# Altium schematic sheet [0] LattePanda_Mu.SchDoc
size B; Organization: Altium Limited; Address1: L3, 12a Rodborough Rd; Address2: Frenchs Forest; Address3: NSW; Address4: Australia 2086
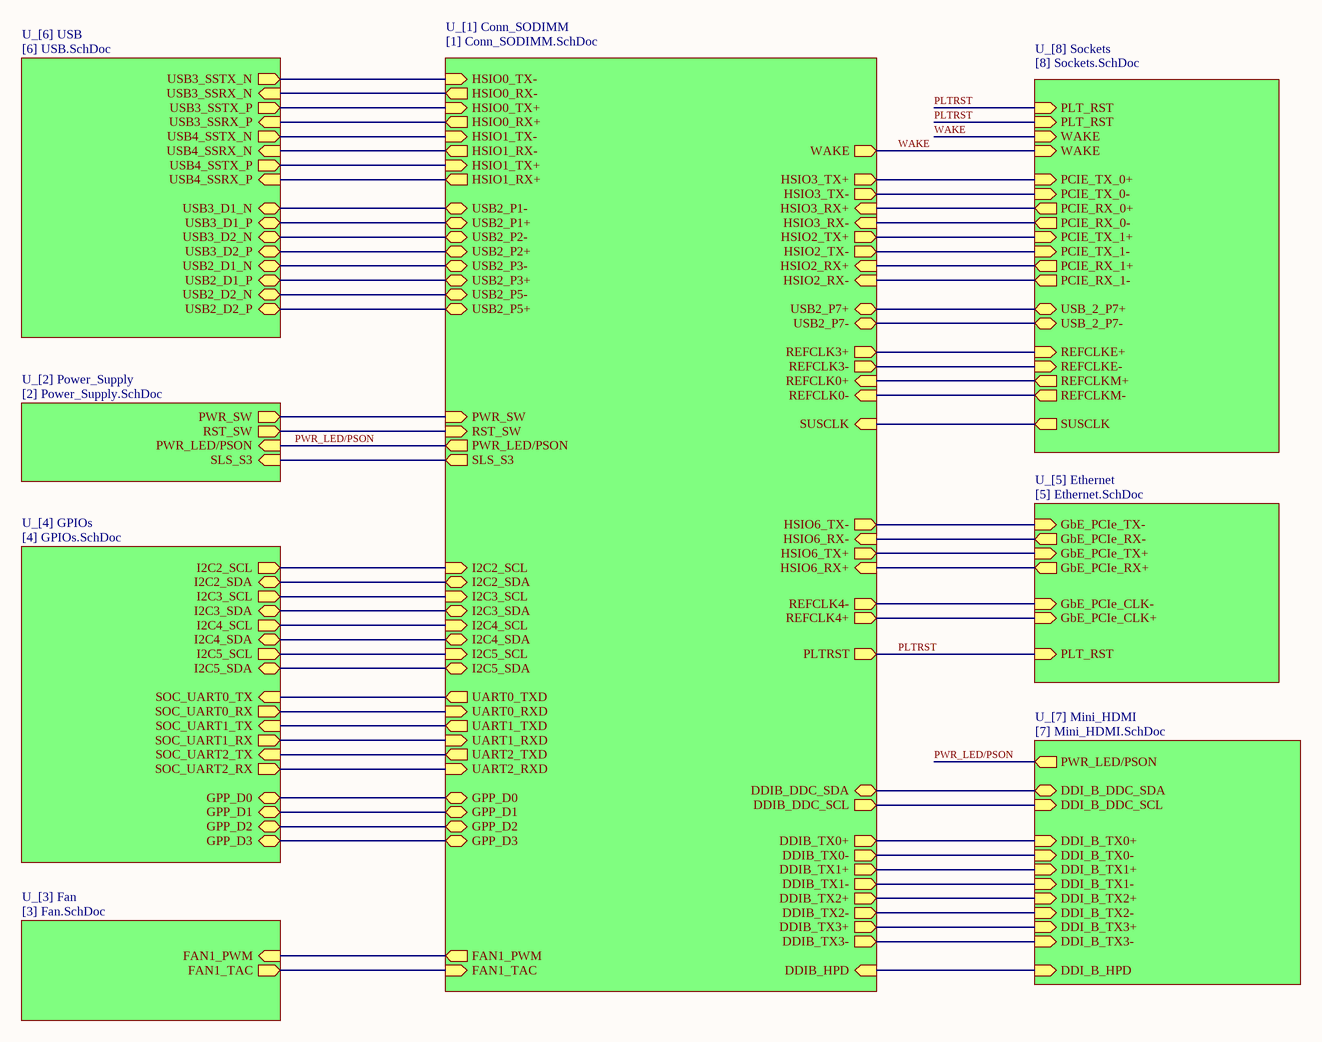
[diagram p0: [0] LattePanda_Mu.SchDoc]

## Sub-sheets
U_[1] Conn_SODIMM = [1] Conn_SODIMM.SchDoc: SLS_S3 (out), HSIO2_TX+ (out), HSIO2_TX- (out), HSIO3_TX+ (out), HSIO3_TX- (out), HSIO6_TX+ (out), HSIO6_TX- (out), HSIO2_RX+ (in), HSIO2_RX- (in), HSIO3_RX+ (in), HSIO3_RX- (in), HSIO6_RX+ (in), HSIO6_RX- (in), USB2_P1- (bidir), USB2_P1+ (bidir), USB2_P2+ (bidir), USB2_P2- (bidir), USB2_P3+ (bidir), USB2_P3- (bidir), USB2_P7+ (bidir), USB2_P7- (bidir), DDIB_HPD (in), DDIB_DDC_SDA (bidir), DDIB_DDC_SCL (out), DDIB_TX3+ (out), DDIB_TX3- (out), DDIB_TX2+ (out), DDIB_TX2- (out), DDIB_TX1+ (out), DDIB_TX1- (out), DDIB_TX0+ (out), DDIB_TX0- (out), FAN1_TAC (in), FAN1_PWM (out), WAKE (out), PLTRST (out), USB2_P5+ (bidir), USB2_P5- (bidir), SUSCLK (in), GPP_D0 (bidir), GPP_D1 (bidir), GPP_D2 (bidir), GPP_D3 (bidir), UART0_RXD (in), UART0_TXD (out), UART1_RXD (in), UART1_TXD (out), UART2_RXD (in), UART2_TXD (out), I2C2_SDA (bidir), I2C3_SDA (bidir), I2C4_SDA (bidir), I2C5_SDA (bidir), I2C2_SCL (in), I2C3_SCL (in), I2C4_SCL (in), I2C5_SCL (in), PWR_SW (in), RST_SW (in), PWR_LED/PSON (out), HSIO0_TX+ (in), HSIO1_RX- (out), HSIO1_RX+ (out), HSIO0_RX- (out), HSIO0_RX+ (out), HSIO1_TX- (in), HSIO1_TX+ (in), HSIO0_TX- (in), REFCLK4+ (out), REFCLK4- (out), REFCLK0- (in), REFCLK0+ (in), REFCLK3+ (out), REFCLK3- (out)
U_[2] Power_Supply = [2] Power_Supply.SchDoc: SLS_S3 (in), PWR_LED/PSON (in), PWR_SW (out), RST_SW (out)
U_[3] Fan = [3] Fan.SchDoc: FAN1_TAC (out), FAN1_PWM (in)
U_[4] GPIOs = [4] GPIOs.SchDoc: I2C2_SDA (bidir), I2C3_SDA (bidir), I2C4_SDA (bidir), I2C5_SDA (bidir), I2C2_SCL (out), I2C3_SCL (out), I2C4_SCL (out), I2C5_SCL (out), SOC_UART0_RX (out), SOC_UART1_RX (out), SOC_UART2_RX (out), SOC_UART0_TX (in), SOC_UART1_TX (in), SOC_UART2_TX (in), GPP_D0 (bidir), GPP_D1 (bidir), GPP_D2 (bidir), GPP_D3 (bidir)
U_[5] Ethernet = [5] Ethernet.SchDoc: GbE_PCIe_TX- (in), GbE_PCIe_TX+ (in), GbE_PCIe_RX- (out), GbE_PCIe_RX+ (out), GbE_PCIe_CLK- (in), GbE_PCIe_CLK+ (in), PLT_RST (in)
U_[6] USB = [6] USB.SchDoc: USB3_SSRX_N (in), USB3_SSRX_P (in), USB3_SSTX_N (out), USB3_SSTX_P (out), USB4_SSRX_N (in), USB4_SSRX_P (in), USB4_SSTX_N (out), USB4_SSTX_P (out), USB2_D2_P (bidir), USB2_D1_P (bidir), USB3_D1_P (bidir), USB2_D1_N (bidir), USB3_D2_P (bidir), USB3_D1_N (bidir), USB3_D2_N (bidir), USB2_D2_N (bidir)
U_[7] Mini_HDMI = [7] Mini_HDMI.SchDoc: DDI_B_TX0+ (in), DDI_B_TX0- (in), DDI_B_TX1+ (in), DDI_B_TX1- (in), DDI_B_TX2+ (in), DDI_B_TX2- (in), DDI_B_TX3+ (in), DDI_B_TX3- (in), PWR_LED/PSON (out), DDI_B_DDC_SDA (bidir), DDI_B_HPD (in), DDI_B_DDC_SCL (in)
U_[8] Sockets = [8] Sockets.SchDoc: PLT_RST (in), WAKE (in), PCIE_TX_1+ (in), PCIE_TX_1- (in), PCIE_RX_1+ (out), PCIE_RX_1- (out), REFCLKM+ (out), REFCLKM- (out), PLT_RST (in), WAKE (in), PCIE_TX_0+ (in), PCIE_TX_0- (in), PCIE_RX_0+ (out), PCIE_RX_0- (out), USB_2_P7+ (bidir), USB_2_P7- (bidir), REFCLKE+ (in), REFCLKE- (in), SUSCLK (out)

## Nets
PLTRST: sheet U_[1] Conn_SODIMM/PLTRST, sheet U_[5] Ethernet/PLT_RST, sheet U_[8] Sockets/PLT_RST, sheet U_[8] Sockets/PLT_RST
PWR_LED/PSON: sheet U_[1] Conn_SODIMM/PWR_LED/PSON, sheet U_[2] Power_Supply/PWR_LED/PSON, sheet U_[7] Mini_HDMI/PWR_LED/PSON
WAKE: sheet U_[1] Conn_SODIMM/WAKE, sheet U_[8] Sockets/WAKE, sheet U_[8] Sockets/WAKE
(unnamed): sheet U_[1] Conn_SODIMM/SLS_S3, sheet U_[2] Power_Supply/SLS_S3
(unnamed): sheet U_[1] Conn_SODIMM/HSIO2_TX+, sheet U_[8] Sockets/PCIE_TX_1+
(unnamed): sheet U_[1] Conn_SODIMM/HSIO2_TX-, sheet U_[8] Sockets/PCIE_TX_1-
(unnamed): sheet U_[1] Conn_SODIMM/HSIO3_TX+, sheet U_[8] Sockets/PCIE_TX_0+
(unnamed): sheet U_[1] Conn_SODIMM/HSIO3_TX-, sheet U_[8] Sockets/PCIE_TX_0-
(unnamed): sheet U_[1] Conn_SODIMM/HSIO6_TX+, sheet U_[5] Ethernet/GbE_PCIe_TX+
(unnamed): sheet U_[1] Conn_SODIMM/HSIO6_TX-, sheet U_[5] Ethernet/GbE_PCIe_TX-
(unnamed): sheet U_[1] Conn_SODIMM/HSIO2_RX+, sheet U_[8] Sockets/PCIE_RX_1+
(unnamed): sheet U_[1] Conn_SODIMM/HSIO2_RX-, sheet U_[8] Sockets/PCIE_RX_1-
(unnamed): sheet U_[1] Conn_SODIMM/HSIO3_RX+, sheet U_[8] Sockets/PCIE_RX_0+
(unnamed): sheet U_[1] Conn_SODIMM/HSIO3_RX-, sheet U_[8] Sockets/PCIE_RX_0-
(unnamed): sheet U_[1] Conn_SODIMM/HSIO6_RX+, sheet U_[5] Ethernet/GbE_PCIe_RX+
(unnamed): sheet U_[1] Conn_SODIMM/HSIO6_RX-, sheet U_[5] Ethernet/GbE_PCIe_RX-
(unnamed): sheet U_[1] Conn_SODIMM/USB2_P1-, sheet U_[6] USB/USB3_D1_N
(unnamed): sheet U_[1] Conn_SODIMM/USB2_P1+, sheet U_[6] USB/USB3_D1_P
(unnamed): sheet U_[1] Conn_SODIMM/USB2_P2+, sheet U_[6] USB/USB3_D2_P
(unnamed): sheet U_[1] Conn_SODIMM/USB2_P2-, sheet U_[6] USB/USB3_D2_N
(unnamed): sheet U_[1] Conn_SODIMM/USB2_P3+, sheet U_[6] USB/USB2_D1_P
(unnamed): sheet U_[1] Conn_SODIMM/USB2_P3-, sheet U_[6] USB/USB2_D1_N
(unnamed): sheet U_[1] Conn_SODIMM/USB2_P7+, sheet U_[8] Sockets/USB_2_P7+
(unnamed): sheet U_[1] Conn_SODIMM/USB2_P7-, sheet U_[8] Sockets/USB_2_P7-
(unnamed): sheet U_[1] Conn_SODIMM/DDIB_HPD, sheet U_[7] Mini_HDMI/DDI_B_HPD
(unnamed): sheet U_[1] Conn_SODIMM/DDIB_DDC_SDA, sheet U_[7] Mini_HDMI/DDI_B_DDC_SDA
(unnamed): sheet U_[1] Conn_SODIMM/DDIB_DDC_SCL, sheet U_[7] Mini_HDMI/DDI_B_DDC_SCL
(unnamed): sheet U_[1] Conn_SODIMM/DDIB_TX3+, sheet U_[7] Mini_HDMI/DDI_B_TX3+
(unnamed): sheet U_[1] Conn_SODIMM/DDIB_TX3-, sheet U_[7] Mini_HDMI/DDI_B_TX3-
(unnamed): sheet U_[1] Conn_SODIMM/DDIB_TX2+, sheet U_[7] Mini_HDMI/DDI_B_TX2+
(unnamed): sheet U_[1] Conn_SODIMM/DDIB_TX2-, sheet U_[7] Mini_HDMI/DDI_B_TX2-
(unnamed): sheet U_[1] Conn_SODIMM/DDIB_TX1+, sheet U_[7] Mini_HDMI/DDI_B_TX1+
(unnamed): sheet U_[1] Conn_SODIMM/DDIB_TX1-, sheet U_[7] Mini_HDMI/DDI_B_TX1-
(unnamed): sheet U_[1] Conn_SODIMM/DDIB_TX0+, sheet U_[7] Mini_HDMI/DDI_B_TX0+
(unnamed): sheet U_[1] Conn_SODIMM/DDIB_TX0-, sheet U_[7] Mini_HDMI/DDI_B_TX0-
(unnamed): sheet U_[1] Conn_SODIMM/FAN1_TAC, sheet U_[3] Fan/FAN1_TAC
(unnamed): sheet U_[1] Conn_SODIMM/FAN1_PWM, sheet U_[3] Fan/FAN1_PWM
(unnamed): sheet U_[1] Conn_SODIMM/USB2_P5+, sheet U_[6] USB/USB2_D2_P
(unnamed): sheet U_[1] Conn_SODIMM/USB2_P5-, sheet U_[6] USB/USB2_D2_N
(unnamed): sheet U_[1] Conn_SODIMM/SUSCLK, sheet U_[8] Sockets/SUSCLK
(unnamed): sheet U_[1] Conn_SODIMM/GPP_D0, sheet U_[4] GPIOs/GPP_D0
(unnamed): sheet U_[1] Conn_SODIMM/GPP_D1, sheet U_[4] GPIOs/GPP_D1
(unnamed): sheet U_[1] Conn_SODIMM/GPP_D2, sheet U_[4] GPIOs/GPP_D2
(unnamed): sheet U_[1] Conn_SODIMM/GPP_D3, sheet U_[4] GPIOs/GPP_D3
(unnamed): sheet U_[1] Conn_SODIMM/UART0_RXD, sheet U_[4] GPIOs/SOC_UART0_RX
(unnamed): sheet U_[1] Conn_SODIMM/UART0_TXD, sheet U_[4] GPIOs/SOC_UART0_TX
(unnamed): sheet U_[1] Conn_SODIMM/UART1_RXD, sheet U_[4] GPIOs/SOC_UART1_RX
(unnamed): sheet U_[1] Conn_SODIMM/UART1_TXD, sheet U_[4] GPIOs/SOC_UART1_TX
(unnamed): sheet U_[1] Conn_SODIMM/UART2_RXD, sheet U_[4] GPIOs/SOC_UART2_RX
(unnamed): sheet U_[1] Conn_SODIMM/UART2_TXD, sheet U_[4] GPIOs/SOC_UART2_TX
(unnamed): sheet U_[1] Conn_SODIMM/I2C2_SDA, sheet U_[4] GPIOs/I2C2_SDA
(unnamed): sheet U_[1] Conn_SODIMM/I2C3_SDA, sheet U_[4] GPIOs/I2C3_SDA
(unnamed): sheet U_[1] Conn_SODIMM/I2C4_SDA, sheet U_[4] GPIOs/I2C4_SDA
(unnamed): sheet U_[1] Conn_SODIMM/I2C5_SDA, sheet U_[4] GPIOs/I2C5_SDA
(unnamed): sheet U_[1] Conn_SODIMM/I2C2_SCL, sheet U_[4] GPIOs/I2C2_SCL
(unnamed): sheet U_[1] Conn_SODIMM/I2C3_SCL, sheet U_[4] GPIOs/I2C3_SCL
(unnamed): sheet U_[1] Conn_SODIMM/I2C4_SCL, sheet U_[4] GPIOs/I2C4_SCL
(unnamed): sheet U_[1] Conn_SODIMM/I2C5_SCL, sheet U_[4] GPIOs/I2C5_SCL
(unnamed): sheet U_[1] Conn_SODIMM/PWR_SW, sheet U_[2] Power_Supply/PWR_SW
(unnamed): sheet U_[1] Conn_SODIMM/RST_SW, sheet U_[2] Power_Supply/RST_SW
(unnamed): sheet U_[1] Conn_SODIMM/HSIO0_TX+, sheet U_[6] USB/USB3_SSTX_P
(unnamed): sheet U_[1] Conn_SODIMM/HSIO1_RX-, sheet U_[6] USB/USB4_SSRX_N
(unnamed): sheet U_[1] Conn_SODIMM/HSIO1_RX+, sheet U_[6] USB/USB4_SSRX_P
(unnamed): sheet U_[1] Conn_SODIMM/HSIO0_RX-, sheet U_[6] USB/USB3_SSRX_N
(unnamed): sheet U_[1] Conn_SODIMM/HSIO0_RX+, sheet U_[6] USB/USB3_SSRX_P
(unnamed): sheet U_[1] Conn_SODIMM/HSIO1_TX-, sheet U_[6] USB/USB4_SSTX_N
(unnamed): sheet U_[1] Conn_SODIMM/HSIO1_TX+, sheet U_[6] USB/USB4_SSTX_P
(unnamed): sheet U_[1] Conn_SODIMM/HSIO0_TX-, sheet U_[6] USB/USB3_SSTX_N
(unnamed): sheet U_[1] Conn_SODIMM/REFCLK4+, sheet U_[5] Ethernet/GbE_PCIe_CLK+
(unnamed): sheet U_[1] Conn_SODIMM/REFCLK4-, sheet U_[5] Ethernet/GbE_PCIe_CLK-
(unnamed): sheet U_[1] Conn_SODIMM/REFCLK0-, sheet U_[8] Sockets/REFCLKM-
(unnamed): sheet U_[1] Conn_SODIMM/REFCLK0+, sheet U_[8] Sockets/REFCLKM+
(unnamed): sheet U_[1] Conn_SODIMM/REFCLK3+, sheet U_[8] Sockets/REFCLKE+
(unnamed): sheet U_[1] Conn_SODIMM/REFCLK3-, sheet U_[8] Sockets/REFCLKE-

## Notes on the sheet
- Title
- Size:
- Date:
- B
- Number:
- Time:
- Revision:
- Sheet
- of
- File: